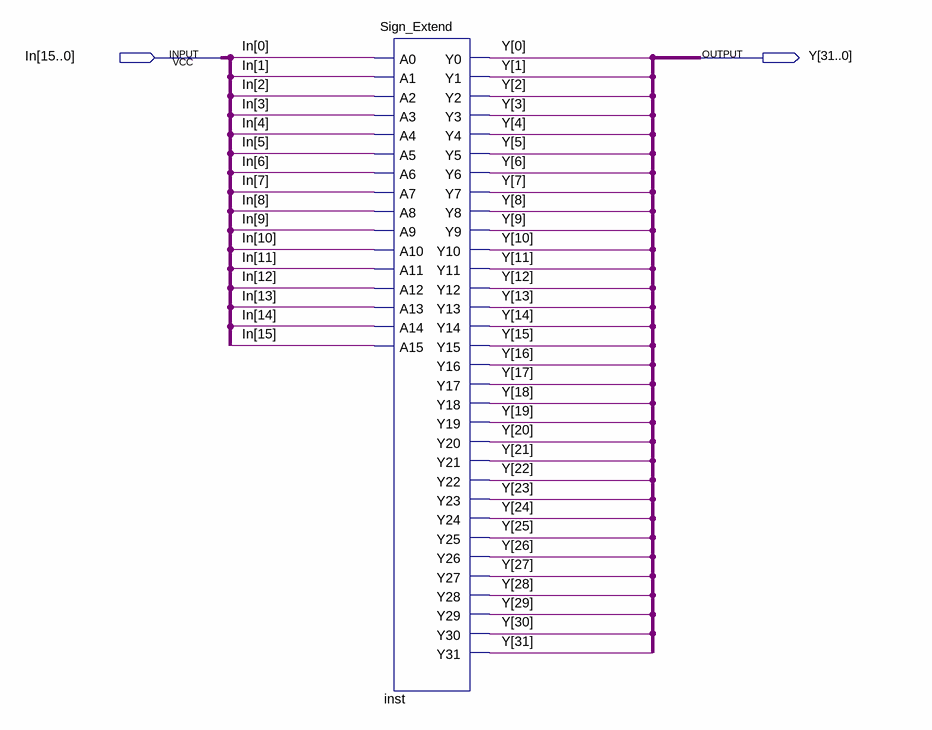
[diagram p0: schematic sheet]
// Quartus schematic Sign_Extend_Bus.bdf as structural Verilog: 1 symbols, 2 pins
module Sign_Extend_Bus (
  input  [15:0] In,
  output [31:0] Y
);

  Sign_Extend inst (
    .A0(In[0]), .A1(In[1]), .A2(In[2]), .A3(In[3]), .A4(In[4]), .A5(In[5]), .A6(In[6]), .A7(In[7]),
    .A8(In[8]), .A9(In[9]), .A10(In[10]), .A11(In[11]), .A12(In[12]), .A13(In[13]), .A14(In[14]),
    .A15(In[15]), .Y0(Y[0]), .Y1(Y[1]), .Y2(Y[2]), .Y3(Y[3]), .Y4(Y[4]), .Y5(Y[5]), .Y6(Y[6]), .Y7(Y[7]),
    .Y8(Y[8]), .Y9(Y[9]), .Y10(Y[10]), .Y11(Y[11]), .Y12(Y[12]), .Y13(Y[13]), .Y14(Y[14]), .Y15(Y[15]),
    .Y16(Y[16]), .Y17(Y[17]), .Y18(Y[18]), .Y19(Y[19]), .Y20(Y[20]), .Y21(Y[21]), .Y22(Y[22]), .Y23(Y[23]),
    .Y24(Y[24]), .Y25(Y[25]), .Y26(Y[26]), .Y27(Y[27]), .Y28(Y[28]), .Y29(Y[29]), .Y30(Y[30]), .Y31(Y[31]));
endmodule
